# Altium schematic sheet 2.Power.SchDoc: TopLevel Schematic
size A4; Date: 2022/5/12; Author: DaiJun; Revision: 1.0; SheetNumber: 2; SheetTotal: 4; Size: A4; Contact: 0731-88731029
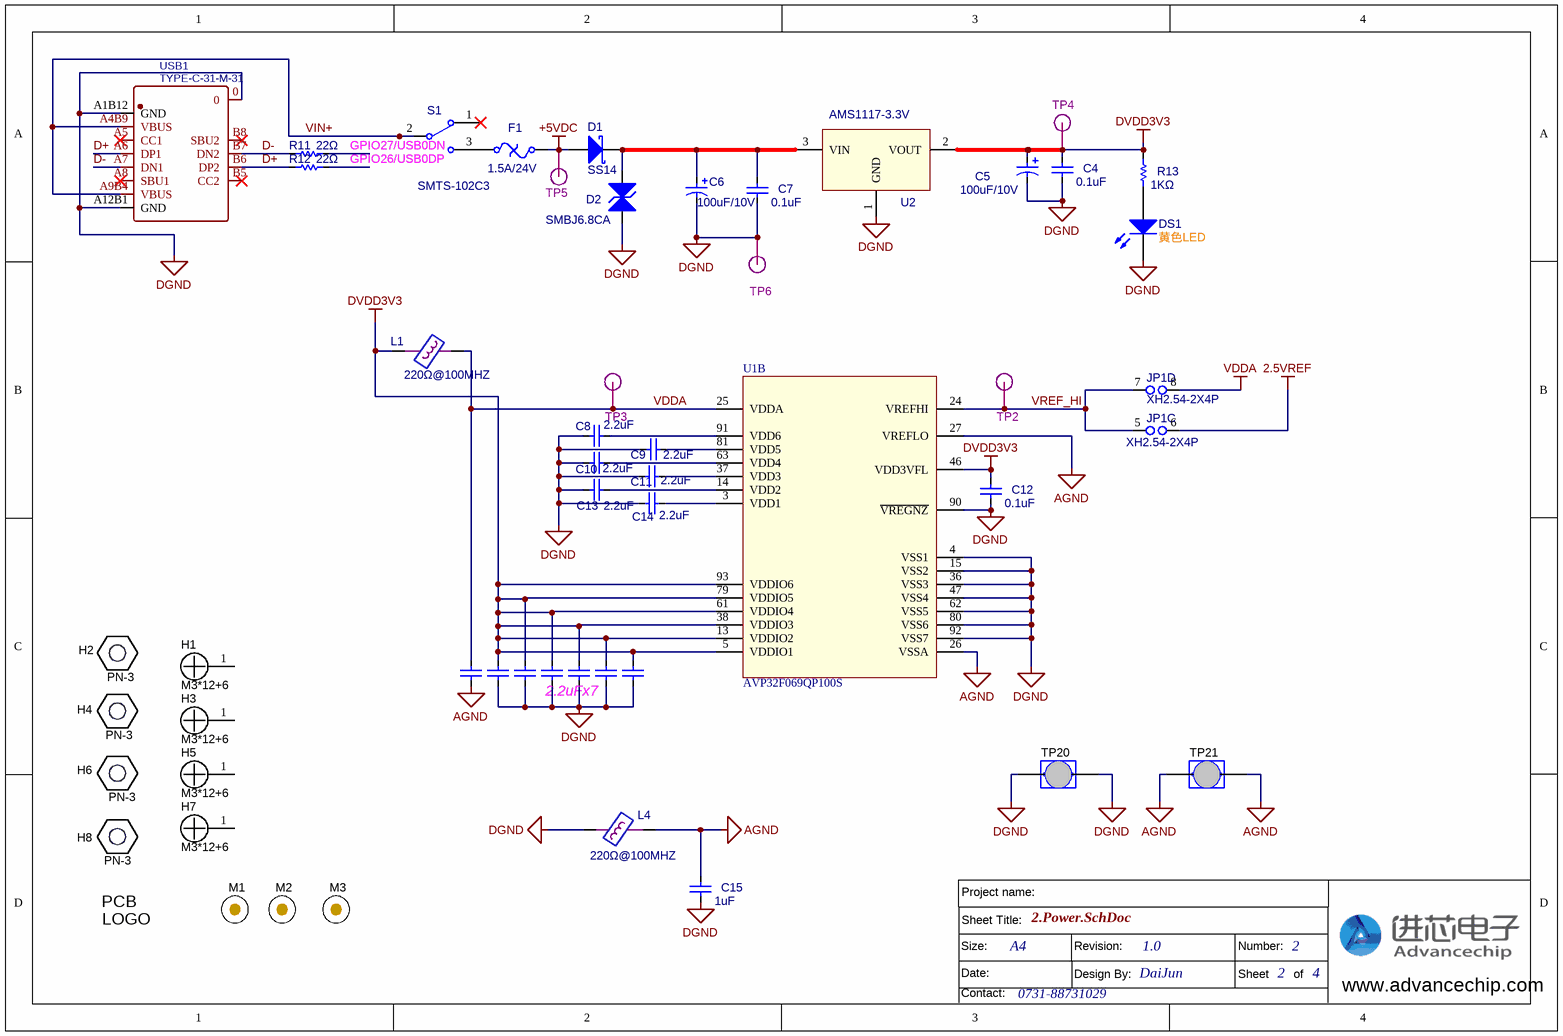
[diagram p0: 2.Power.SchDoc]

## Parts
C4  value 0.1uF  [C0603]  (hidden comment: 0.1uF/50V)
C5  100uF/10V  [CASE-B_3528]
C6  100uF/10V  [CASE-B_3528]
C7  value 0.1uF  [C0603]  (hidden comment: 0.1uF/50V)
C8  value 2.2uF  [C0603]  (hidden comment: 2.2uF/25V)
C9  value 2.2uF  [C0603]  (hidden comment: 2.2uF/25V)
C10  value 2.2uF  [C0603]  (hidden comment: 2.2uF/25V)
C11  value 2.2uF  [C0603]  (hidden comment: 2.2uF/25V)
C12  value 0.1uF  [C0603]  (hidden comment: 0.1uF/50V)
C13  value 2.2uF  [C0603]  (hidden comment: 2.2uF/25V)
C14  value 2.2uF  [C0603]  (hidden comment: 2.2uF/25V)
C15  value 1uF  [C0603]  (hidden comment: 1uF/25V)
C23  2.2uF  [C0603]  (value not drawn)
C26  2.2uF  [C0603]  (value not drawn)
C29  2.2uF  [C0603]  (value not drawn)
C30  2.2uF  [C0603]  (value not drawn)
C31  2.2uF  [C0603]  (value not drawn)
C32  2.2uF  [C0603]  (value not drawn)
C33  2.2uF  [C0603]  (value not drawn)
D1  SS14  [SMA]
D2  SMBJ6.8CA  [SMB2]
DS1  黄色LED  [SMD_LED0805_LED]
F1  1.5A/24V  [1812_PTC_NP]
H1  M3*12+6  [NY PMS 440 0025 PH]
H2  PN-3  [Keystone_1902C]
H3  M3*12+6  [NY PMS 440 0025 PH]
H4  PN-3  [Keystone_1902C]
H5  M3*12+6  [NY PMS 440 0025 PH]
H6  PN-3  [Keystone_1902C]
H7  M3*12+6  [NY PMS 440 0025 PH]
H8  PN-3  [Keystone_1902C]
JP1  XH2.54-2X4P  [SIP4X2A]  (parts C,D of 4)
L1  value 220Ω@100MHZ  [L-0805]  (hidden comment: BLM21PG221SN)
L4  value 220Ω@100MHZ  [L-0805]  (hidden comment: BLM21PG221SN)
Logo1  CAUTION.  READ USER GUIDE BEFORE USE  [IEC_Caution_Small]  (value not drawn)  (no BOM)
M1  (no value)  [Mark1]
M2  (no value)  [Mark1]
M3  (no value)  [Mark1]
R11  22Ω  [0805RX]
R12  22Ω  [0805RX]
R13  1KΩ  [R0603]
S1  SMTS-102C3  [SW2]
TP2  VREFHI  [TEST-0.8/1.5MM]  (value not drawn)
TP3  VDDA  [TEST-0.8/1.5MM]  (value not drawn)
TP4  +3V3  [TEST-0.8/1.5MM]  (value not drawn)
TP5  VIN+  [TEST-0.8/1.5MM]  (value not drawn)
TP6  DGND  [TEST-0.8/1.5MM]  (value not drawn)
TP20  D3082-05  [Harwin_D3082-05]  (value not drawn)
TP21  D3082-05  [Harwin_D3082-05]  (value not drawn)
U1  AVP32F069QP100S  (part B of 2)
U2  AMS1117-3.3V  [SOT-223]
USB1  TYPE-C-31-M-31  [USB-C-SMD-16P]

## Nets
2.5VREF: JP1.6
+5VDC: D1.1 F1.2 TP5.1
AGND: C15.1 C23.1 L4.2 TP21.1 TP21.2 U1.26(VSSA) U1.27(VREFLO)
DGND: C4.2 C5.2 C6.2 C7.2 C8.1 C9.1 C10.1 C11.1 C12.2 C13.1 C14.1 C15.2 C26.1 C29.1 C30.1 C31.1 C32.1 C33.1 D2.1(A) DS1.2(K) L4.1 TP6.1 TP20.1 TP20.2 U1.4(VSS1) U1.15(VSS2) U1.36(VSS3) U1.47(VSS4) U1.62(VSS5) U1.80(VSS6) U1.90(~{VREGNZ}) U1.92(VSS7) U2.1(GND) USB1.0 USB1.A1B12(GND) USB1.A12B1(GND)
DVDD3V3: C4.1 C5.1 C12.1 C26.2 C29.2 C30.2 C31.2 C32.2 C33.2 L1.2 R13.1 TP4.1 U1.5(VDDIO1) U1.13(VDDIO2) U1.38(VDDIO3) U1.46(VDD3VFL) U1.61(VDDIO4) U1.79(VDDIO5) U1.93(VDDIO6) U2.2(VOUT)
VDDA: C23.2 JP1.8 L1.1 TP3.1 U1.25(VDDA)
D+: R12.1 USB1.A6(DP1) USB1.B6(DP2)
D-: R11.1 USB1.A7(DN1) USB1.B7(DN2)
GPIO26/USB0DP: R12.2
GPIO27/USB0DN: R11.2
VIN+: S1.2 USB1.A4B9(VBUS) USB1.A9B4(VBUS)
VREF_HI: JP1.5 JP1.7 TP2.1 U1.24(VREFHI)
NetC6_1: C6.1 C7.1 D1.2 D2.2(K) U2.3(VIN)
NetC8_2: C8.2 U1.81(VDD5)
NetC9_2: C9.2 U1.37(VDD3)
NetC10_2: C10.2 U1.63(VDD4)
NetC11_2: C11.2 U1.14(VDD2)
NetC13_2: C13.2 U1.91(VDD6)
NetC14_2: C14.2 U1.3(VDD1)
NetDS1_1: DS1.1(A) R13.2
NetF1_1: F1.1 S1.3

Not connected (* = marked no-connect by the designer): H1 1; H3 1; H5 1; H7 1; S1 1*; USB1 A5(CC1)* A8(SBU1)* B5(CC2)* B8(SBU2)*

## Notes on the sheet
- 2.2uFx7
- Sheet Title:
- Project name:
- Size:
- Date:
- Contact:
- Revision:
- Design By:
- Number:
- Sheet       of
- www.advancechip.com
- (in symbol CMP-0074836-1) PCB; LOGO

## Library data of the parts
C4 C7-C15 C23 C26 C29-C33 = Cap: 贴片电容; Published: 8-Jun-2000; LatestRevisionDate: 17-Jul-2002; LatestRevisionNote: Re-released for DXP Platform.; Publisher: Altium Limited
  C23 C26 C29-C33: Value: 2.2uF
C5 C6 = CAP2: 钽电容; Brand Name: 三星; Tolerance error: 10%; cost: ￥0.01
D1 = D Schottky: 肖特基二极管; Published: 8-Jun-2000; LatestRevisionDate: 17-Jul-2002; LatestRevisionNote: Re-released for DXP Platform.; Publisher: Altium Limited; Code_JEDEC: DO-214-AA
D2 = TVS: TVS二极管; Published: 8-Jun-2000; LatestRevisionDate: 17-Jul-2002; LatestRevisionNote: Re-released for DXP Platform.; Publisher: Altium Limited
DS1 = LED0: 发光二极管; Published: 8-Jun-2000; LatestRevisionDate: 08-Jul-2005; LatestRevisionNote: Mech Layer 1 removed.; PackageReference: LED-0; Publisher: Altium Limited; PackageDescription: LED; 2 Leads
F1 = Fuse Thermal: 自恢复保险丝; Published: 24-Mar-1999; LatestRevisionDate: 17-Jul-2002; LatestRevisionNote: Re-released for DXP Platform.; PackageReference: PIN-W2/E2.8; Publisher: Altium Limited
H1 H3 H5 H7 = CMP-0003617-1: 安装孔
H2 H4 H6 H8 = CMP-0003610-1: Standoff, Hex, 0.5"L #4-40 Nylon
JP1 = Jumper2: 2.54双排插针; Published: 24-Mar-1999; LatestRevisionDate: 17-Jul-2002; LatestRevisionNote: Re-released for DXP Platform.; Publisher: Altium Limited
L1 L4 = FB1: 贴片电感; Code_IEC: 1005; Published: 8-Jun-2000; LatestRevisionDate: 29-May-2009; LatestRevisionNote: IPC-7351 Footprint Added.; PackageReference: 0402-A; Publisher: Altium Limited; PackageDescription: Chip Inductor; Code_JEITA: 0402
Logo1 = CMP-0074836-1: IEC 61010-1 Caution Warning
M1-M3 = CMP-0077181-1: MARK点
R11-R13 = Res: 贴片电阻; Value: 1K; Published: 8-Jun-2000; LatestRevisionDate: 17-Jul-2002; LatestRevisionNote: Re-released for DXP Platform.; Publisher: Altium Limited
S1 = SW-SPDT: 红色卧式弯脚小型扭子开关5脚2档; Published: 24-Mar-1999; LatestRevisionDate: 17-Dec-2003; LatestRevisionNote: Schematic revised, PCB Footprint replaced.; DatasheetDocument: 05-Dec-2000; Publisher: Altium Limited
TP2-TP6 = TP: 测试点
TP20 TP21 = CMP-0075110-1: 锰铜采样电阻 脚距10mm; Manufacturer: Harwin; CompType: Jumper Wire; CNHeader: False; Green_Lifecycle: Active; Green_REACh: Passed; PartNumber: D3082-05; PackageReference: Shorting Plug, 10.16mm spacing, TH; RoHS: Y; MountType: TH; ComponentLink1Description: Datasheet URL; ComponentLink1URL: http://cdn.harwin.com/pdfs/D3080-D3083.pdf; Publisher: Texas Instruments; LatestRevisionDate: 2017-07-12; Supplier 1: Digi-Key; Supplier Part Number 1: 952-1873-ND; Supplier 2: Newark; Supplier Part Number 2: 01E9240; Supplier 3: Mouser; Supplier Part Number 3: 855-D3082-05; CT: False; Green_EU RoHS-2: Passed; Green_EU RoHS: Passed with Exemption
U1 = AVP32F069QP100S: 进芯32位浮点DSP
U2 = ASM1117-3.3V: 线性稳压器
USB1 = TYPE-C-31-M-31: Type-C 母座 卧贴; BOM_Manufacturer: 韩国韩荣; Contributor: LCSC; BOM_Supplier: LCSC; BOM_Supplier Part: C2760486; BOM_Manufacturer Part: TYPE-C-31-M-31; JLCPCB Part Class: Extended Part; BOM_JLCPCB Part Class: Extended Part; spicePre: U; spiceSymbolName: TYPE-C-31-M-31